# EasyEDA Pro project TEMP_PRO.epro, schematic Schematic_5, sheets 1 to 2 of 3

## Sheets
1 P1: Board Name: Board_5; Create Date: 2025-04-01; Page Name: P1; Project Name: TEMP_PRO-1; Schematic Name: Schematic_5; Update Date: 2025-04-03; Company: EasyEDA.com; Drawed: EasyEDA Pro; Drawn: EasyEDA; Page Size: A3; Part Number: JLCPCB-001; Reviewed: EasyEDA Pro; Version: V0.1
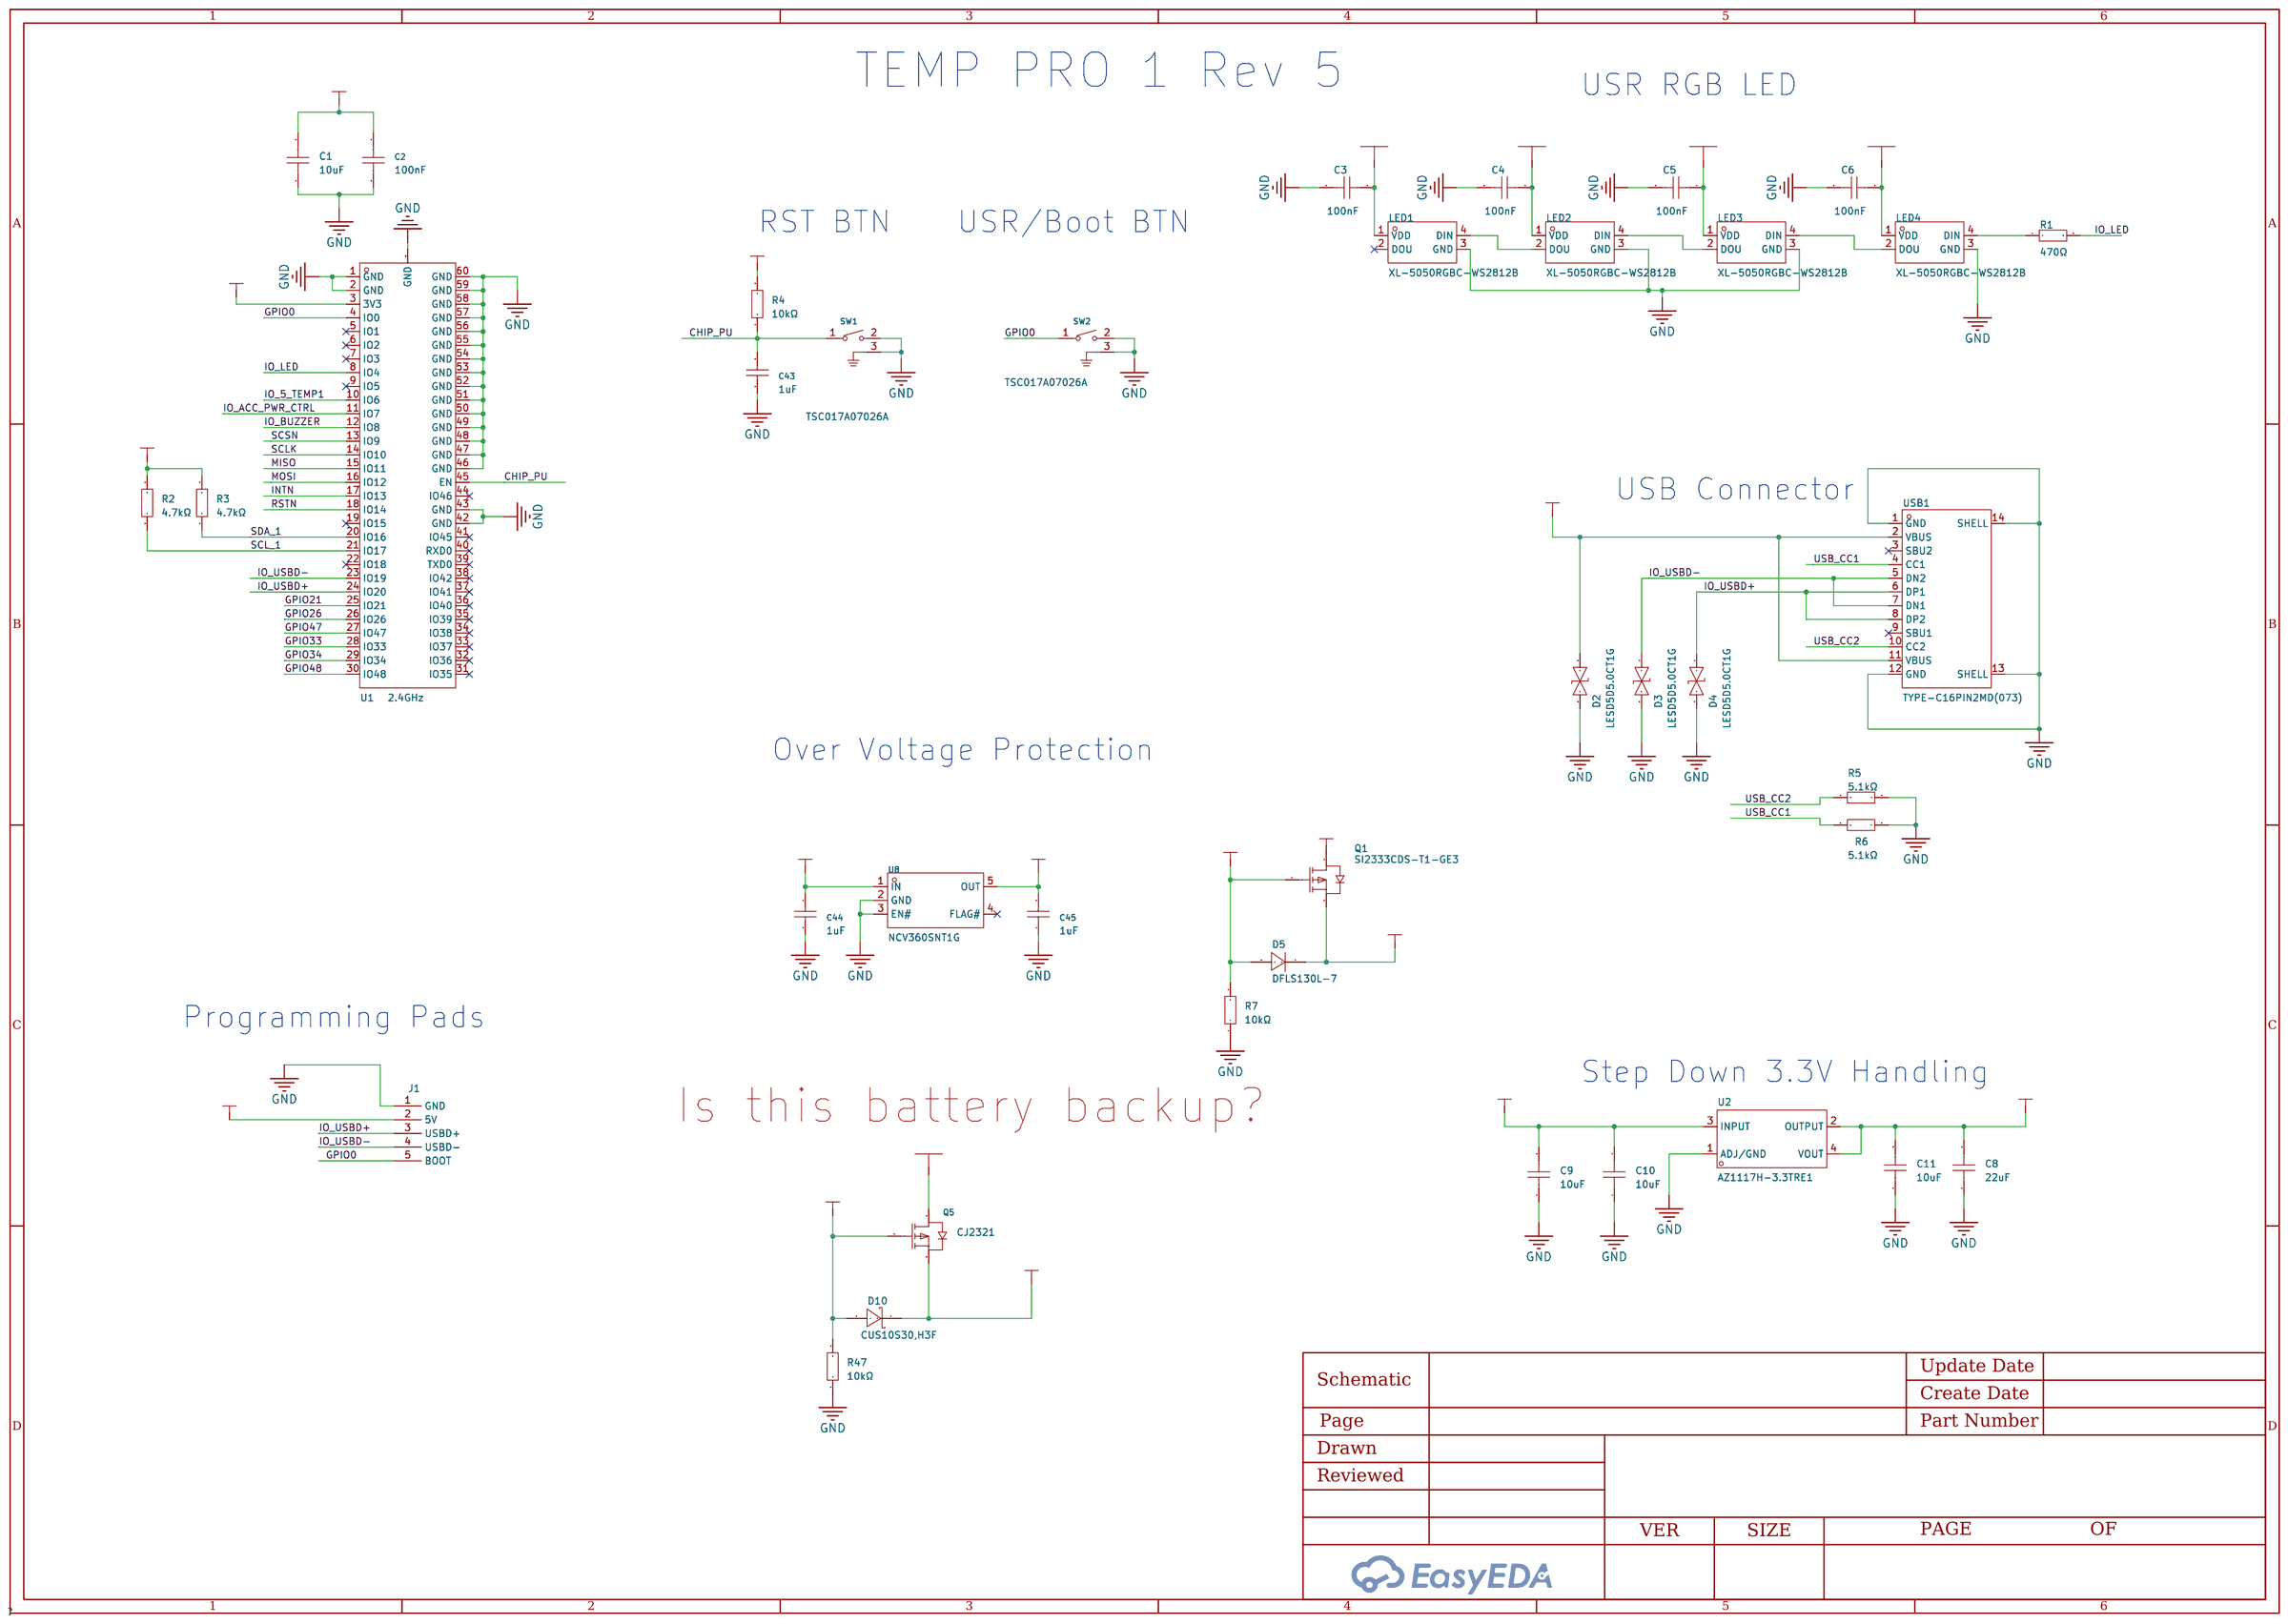
[diagram p0: P1]
2 P2: Board Name: Board_1; Create Date: 2024-09-09
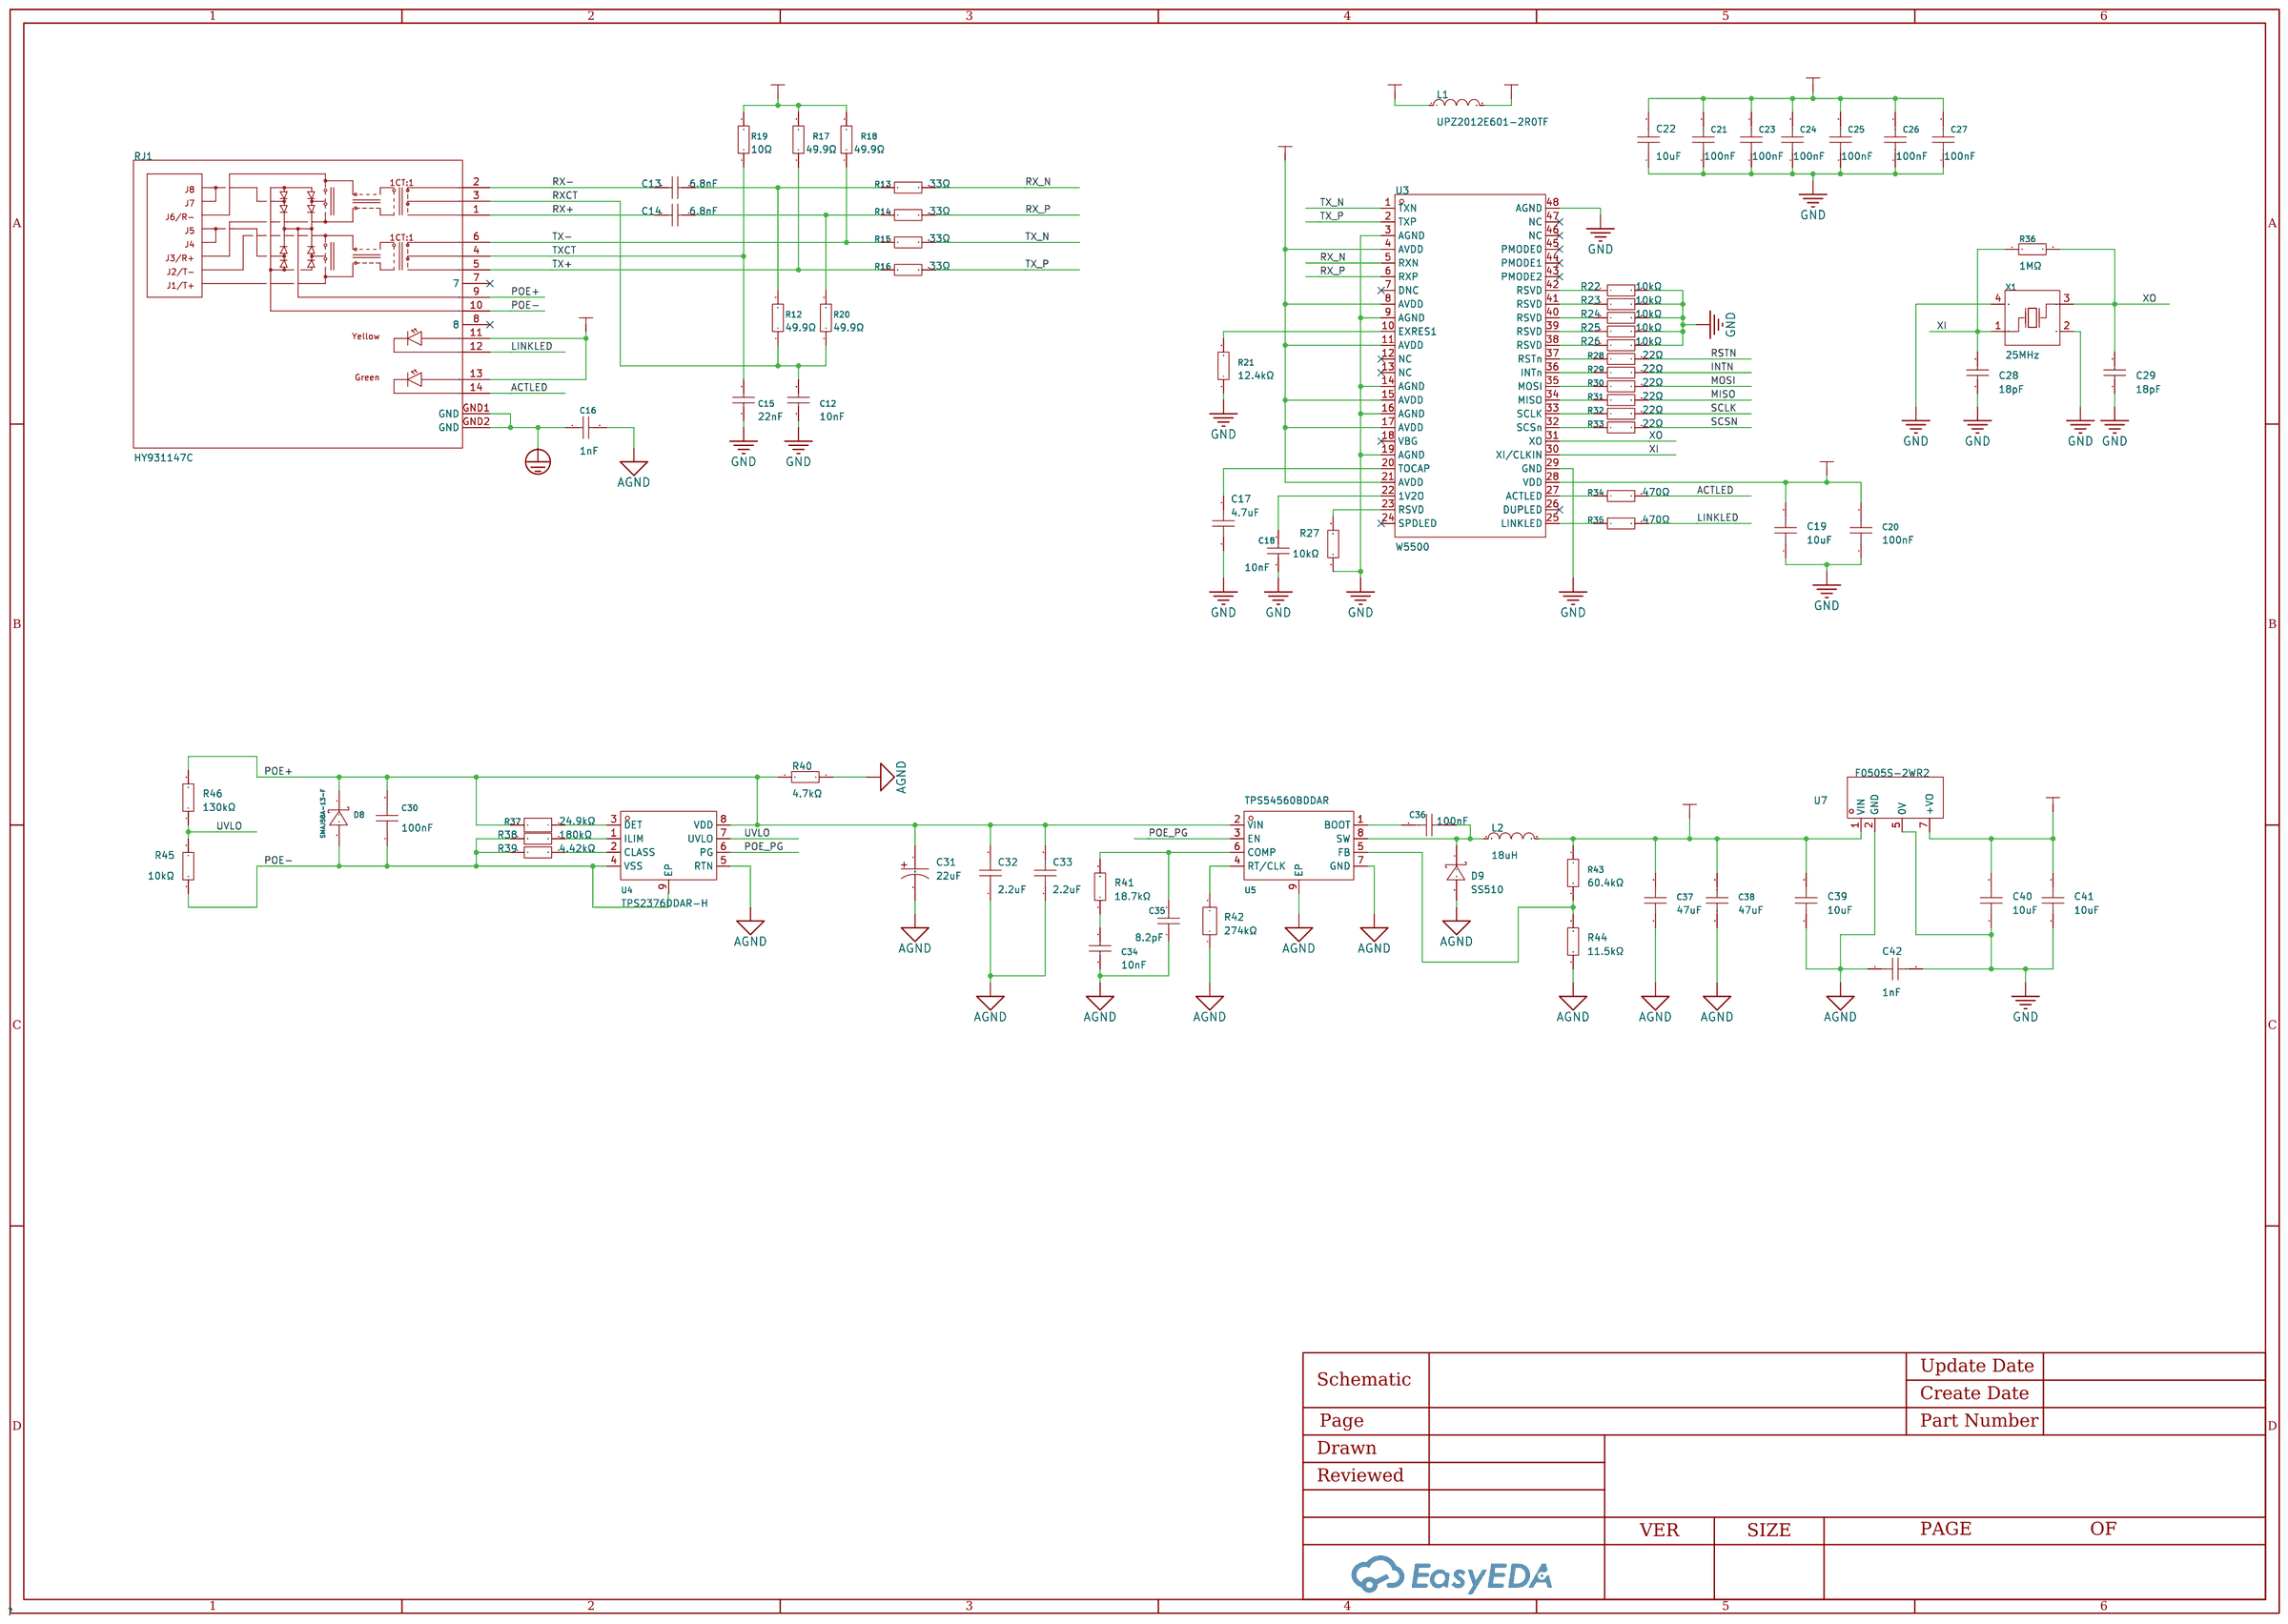
[diagram p1: P2]

## Parts
sheet P1
C1  10uF  [C0603]
C2  100nF  [C0402]
C3  100nF  [C0402]
C4  100nF  [C0402]
C5  100nF  [C0402]
C6  100nF  [C0402]
C8  22uF  [C0805]
C9  10uF  [C0603]
C10  10uF  [C0603]
C11  10uF  [C0603]
C43  1uF  [C0402]
C44  1uF  [C0402]
C45  1uF  [C0402]
D2  LESD5D5.0CT1G  [SOD-523_L1.2-W0.8-LS1.6-BI]
D3  LESD5D5.0CT1G  [SOD-523_L1.2-W0.8-LS1.6-BI]
D4  LESD5D5.0CT1G  [SOD-523_L1.2-W0.8-LS1.6-BI]
D5  DFLS130L-7  [POWERDI-123_L2.8-W1.8-LS3.7-RD]
D10  CUS10S30,H3F  [SOD-323_L1.8-W1.3-LS2.5-RD]
J1  -  [Programming Pads]
LED1  XL-5050RGBC-WS2812B  [LED-SMD_4P-L5.0-W5.0-BL_XL-5050RGBC]
LED2  XL-5050RGBC-WS2812B  [LED-SMD_4P-L5.0-W5.0-BL_XL-5050RGBC]
LED3  XL-5050RGBC-WS2812B  [LED-SMD_4P-L5.0-W5.0-BL_XL-5050RGBC]
LED4  XL-5050RGBC-WS2812B  [LED-SMD_4P-L5.0-W5.0-BL_XL-5050RGBC]
Q1  SI2333CDS-T1-GE3  [SOT-23_L2.9-W1.3-P1.90-LS2.4-BR]
Q5  CJ2321  [SOT-23-3_L2.9-W1.3-P1.90-LS2.4-BR]
R1  470Ω  [R0402]
R2  4.7kΩ  [R0402]
R3  4.7kΩ  [R0402]
R4  10kΩ  [R0402]
R5  5.1kΩ  [R0402]
R6  5.1kΩ  [R0402]
R7  10kΩ  [R0402]
R47  10kΩ  [R0402]
SW1  TSC017A07026A  [SW-TH_3P-L4.5-W7.0-P3.00-LS1.9]
SW2  TSC017A07026A  [SW-TH_3P-L4.5-W7.0-P3.00-LS1.9]
U1  2.4GHz  [BULETM-SMD_ESP32-S3-MINI-1-N8]
U2  AZ1117H-3.3TRE1  [SOT-223-3_L6.5-W3.4-P2.30-LS7.0-BR]
U8  NCV360SNT1G  [TSOP-5_L3.0-W1.5-P0.95-LS2.8-BL]
USB1  TYPE-C16PIN2MD(073)  [USB-C-SMD_TYPE-C-6PIN-2MD-073]
sheet P2
C12  10nF  [C0603]
C13  6.8nF  [C0402]
C14  6.8nF  [C0402]
C15  22nF  [C0603]
C16  1nF  [C1206]
C17  4.7uF  [C0603]
C18  10nF  [C0603]
C19  10uF  [C0603]
C20  100nF  [C0402]
C21  100nF  [C0402]
C22  10uF  [C0603]
C23  100nF  [C0402]
C24  100nF  [C0402]
C25  100nF  [C0402]
C26  100nF  [C0402]
C27  100nF  [C0402]
C28  18pF  [C0402]
C29  18pF  [C0402]
C30  100nF  [C0603]
C31  22uF  [CAP-SMD_BD8.0-L8.3-W8.3-RD]
C32  2.2uF  [C1206]
C33  2.2uF  [C1206]
C34  10nF  [C0402]
C35  8.2pF  [C0402]
C36  100nF  [C0402]
C37  47uF  [C1210]
C38  47uF  [C1210]
C39  10uF  [C0603]
C40  10uF  [C0603]
C41  10uF  [C0603]
C42  1nF  [C1808]
D8  SMAJ58A-13-F  [SMA_L4.4-W2.6-LS5.0-RD]
D9  SS510  [SMA_L4.3-W2.6-LS5.2-RD]
L1  UPZ2012E601-2R0TF  [L0805]
L2  18uH  [IND-SMD_L12.0-W12.0_CDRH127NP]
R12  49.9Ω  [R0402]
R13  33Ω  [R0402]
R14  33Ω  [R0402]
R15  33Ω  [R0402]
R16  33Ω  [R0402]
R17  49.9Ω  [R0402]
R18  49.9Ω  [R0402]
R19  10Ω  [R0402]
R20  49.9Ω  [R0402]
R21  12.4kΩ  [R0402]
R22  10kΩ  [R0402]
R23  10kΩ  [R0402]
R24  10kΩ  [R0402]
R25  10kΩ  [R0402]
R26  10kΩ  [R0402]
R27  10kΩ  [R0402]
R28  22Ω  [R0402]
R29  22Ω  [R0402]
R30  22Ω  [R0402]
R31  22Ω  [R0402]
R32  22Ω  [R0402]
R33  22Ω  [R0402]
R34  470Ω  [R0402]
R35  470Ω  [R0402]
R36  1MΩ  [R0402]
R37  24.9kΩ  [R0402]
R38  180kΩ  [R0402]
R39  4.42kΩ  [R0402]
R40  4.7kΩ  [R2512]
R41  18.7kΩ  [R0402]
R42  274kΩ  [R0402]
R43  60.4kΩ  [R0402]
R44  11.5kΩ  [R0402]
R45  10kΩ  [R0402]
R46  130kΩ  [R0402]
RJ1  HY931147C  [RJ45-TH_HY931147C]
U3  W5500  [LQFP-48_L7.0-W7.0-P0.50-LS9.0-BL]
U4  TPS2376DDAR-H  [SO-8_L4.9-W3.9-P1.27-LS6.0-BL-EP]
U5  TPS54560BDDAR  [POWERPAD-SO-8_L4.9-W3.9-P1.27-LS6.0-BL-EP]
U7  F0505S-2WR2  [PWRM-TH_FXXXXS-1WR2]
X1  25MHz  [CRYSTAL-SMD_4P-L3.2-W2.5-BL]

## Library data of the parts
C1 C19 C22 C39-C41 = GRM188C81C106MA73D: Capacitance: Tolerance:±20% Tolerance:±20% Voltage Rated: Temperature Coefficient:; LCSC Part Name: 10uF ±20% 16V; Supplier Part: C182375; Manufacturer: muRata(村田); Supplier Footprint: 0603; Datasheet: https://atta.szlcsc.com/upload/public/pdf/source/20230811/1729A96BC8A22EEF5EFB369A2EE6989A.pdf; Supplier: LCSC; Tolerance: ±20%
C2-C6 C20 C21 C23-C27 C36 = CC0402KRX7R7BB104: Capacitance: Tolerance:±10% Tolerance:±10% Voltage Rated: Temperature Coefficient:; LCSC Part Name: 100nF ±10% 16V; Supplier Part: C60474; Manufacturer: YAGEO(国巨); Supplier Footprint: 0402; JLCPCB Part Class: Extended Part; Datasheet: https://atta.szlcsc.com/upload/public/pdf/source/20211223/9278FD768280B81DDBEF48FA36411A03.pdf; Supplier: LCSC; Tolerance: ±10%
C8 = GRM21BZ71A226ME15L: Capacitance: Tolerance:±20% Tolerance:±20% Voltage Rated: Temperature Coefficient:; LCSC Part Name: 22uF ±20% 10V; Supplier Part: C907991; Manufacturer: muRata(村田); Supplier Footprint: 0805; Datasheet: https://atta.szlcsc.com/upload/public/pdf/source/20201022/C907991_FDD26F97C89A3C2FF3DDCDE25DF37A4B.pdf; Supplier: LCSC; Tolerance: ±20%
C9-C11 = GRM188Z71A106KA73D: Capacitance: Tolerance:±10% Tolerance:±10% Voltage Rated: Temperature Coefficient:; LCSC Part Name: 10uF ±10% 10V; Supplier Part: C2959727; Manufacturer: muRata(村田); Supplier Footprint: 0603; Datasheet: https://atta.szlcsc.com/upload/public/pdf/source/20220328/6A4892B7E841253269A84FFE395E0578.pdf; Supplier: LCSC; Tolerance: ±10%
C43-C45 = GRM155R61E105KA12D: Capacitance: Tolerance:±10% Tolerance:±10% Voltage Rated: Temperature Coefficient:; LCSC Part Name: 1uF ±10% 25V; Supplier Part: C77009; Manufacturer: muRata(村田); Supplier Footprint: 0402; Datasheet: https://atta.szlcsc.com/upload/public/pdf/source/20180326/C77009_C84F63FC30571BAC77C5C818267378FE.pdf; Supplier: LCSC; Tolerance: ±10%
D2-D4 = LESD5D5.0CT1G: Polarity:Bi-Directional Reverse Stand-Off Voltage (Vrwm):5V Breakdown Voltage (VBR):5.6V Peak Pulse Current(Ipp)@8/20us:9.4A Clamping Voltage@Ipp:18.6V; LCSC Part Name: 双向ESD; Supplier Part: C383211; Manufacturer: LRC(乐山无线电); Supplier Footprint: SOD-523; JLCPCB Part Class: ExtendedPart; Datasheet: https://atta.szlcsc.com/upload/public/pdf/source/20190807/C383211_633DF4B4E2C161403226E5235FE33A1C.pdf; Supplier: LCSC; Polarity: Bi-Directional; Reverse Stand-Off Voltage (Vrwm): 5V; Breakdown Voltage (VBR): 5.6V; Peak Pulse Current(Ipp)@8/20us: 9.4A; Clamping Voltage@Ipp: 18.6V
D5 = DFLS130L-7: Forward Voltage (Vf@If):310mV@1A Reverse Voltage (Vr):30V Average Rectified Current (Io):1A; LCSC Part Name: 电压:30V 电流:1A; Supplier Part: C110493; Manufacturer: DIODES(美台); Supplier Footprint: Power-DI-123; JLCPCB Part Class: Extended Part; Datasheet: https://atta.szlcsc.com/upload/public/pdf/source/20170427/1493286393645.pdf; Supplier: LCSC; Forward Voltage (Vf@If): 310mV@1A; Reverse Voltage (Vr): 30V; Average Rectified Current (Io): 1A
D10 = CUS10S30,H3F: Forward Voltage (Vf@If):230mV@100mA Reverse Voltage (Vr):30V Average Rectified Current (Io):1A Reverse Leakage Current (Ir):500uA@30V; LCSC Part Name: 电压:30V 电流:1A; Supplier Part: C146335; Manufacturer: TOSHIBA(东芝); Supplier Footprint: SC-76(SOD-323); JLCPCB Part Class: Extended Part; Datasheet: https://atta.szlcsc.com/upload/public/pdf/source/20171211/C146335_15129763734771175369.pdf; Supplier: LCSC; Forward Voltage (Vf@If): 230mV@100mA; Reverse Voltage (Vr): 30V; Average Rectified Current (Io): 1A; Reverse Leakage Current (Ir): 500uA@30V
J1 = Programming Pad Comp
LED1 = XL-5050RGBC-WS2812B: Emitted Color:RGB Diode Configuration:- Lens Color:Colorless transparence Dominant Wavelength:- Dominant Wavelength:- Peak Wavelength:625nm；470nm；530nm Color Temperature:- Color Temperature:- Forward Current:- Power Dissipation:- Viewing Angle:120° Mounti; LCSC Part Name: RGB三色 正贴 幻彩; Supplier Part: C2843785; Manufacturer: XINGLIGHT(成兴光); Supplier Footprint: SMD5050; JLCPCB Part Class: Extended Part; Datasheet: https://atta.szlcsc.com/upload/public/pdf/source/20230111/86AAD2096485A2E5BCAB883FF8CBE6FD.pdf; Supplier: LCSC; Emitted Color: RGB; Lens Color: Colorless transparence; Peak Wavelength: 625nm；470nm；530nm; Viewing Angle: 120°; Mounting Sytle: Positive post; Operating Temperature: -30℃~+70℃; NO_CONNECT: yes
LED2-LED4 = XL-5050RGBC-WS2812B: Emitted Color:RGB Diode Configuration:- Lens Color:Colorless transparence Dominant Wavelength:- Dominant Wavelength:- Peak Wavelength:625nm；470nm；530nm Color Temperature:- Color Temperature:- Forward Current:- Power Dissipation:- Viewing Angle:120° Mounti; LCSC Part Name: RGB三色 正贴 幻彩; Supplier Part: C2843785; Manufacturer: XINGLIGHT(成兴光); Supplier Footprint: SMD5050; JLCPCB Part Class: Extended Part; Datasheet: https://atta.szlcsc.com/upload/public/pdf/source/20230111/86AAD2096485A2E5BCAB883FF8CBE6FD.pdf; Supplier: LCSC; Emitted Color: RGB; Lens Color: Colorless transparence; Peak Wavelength: 625nm；470nm；530nm; Viewing Angle: 120°; Mounting Sytle: Positive post; Operating Temperature: -30℃~+70℃
Q1 = SI2333CDS-T1-GE3_C48179: Type: Drain Source Voltage (Vdss): Continuous Drain Current (Id): Power Dissipation (Pd):； Drain Source On Resistance (RDS(on)@Vgs,Id):35mΩ@4.5V,5.1A Gate Threshold Voltage (Vgs(th)@Id):1V@250uA Total Gate Charge (Qg@Vgs):25nC@4.5V Input Capacitance (Ciss; LCSC Part Name: P沟道 耐压:12V 电流:5.1A; Supplier Part: C48179; Manufacturer: VISHAY(威世); Supplier Footprint: SOT-23-3; JLCPCB Part Class: Extended Part; Datasheet: https://atta.szlcsc.com/upload/public/pdf/source/20150504/1457707283392.pdf; Supplier: LCSC; Power Dissipation (Pd): ；; Drain Source On Resistance (RDS(on)@Vgs,Id): 35mΩ@4.5V,5.1A; Gate Threshold Voltage (Vgs(th)@Id): 1V@250uA; Total Gate Charge (Qg@Vgs): 25nC@4.5V; Input Capacitance (Ciss@Vds): 1.225nF@6V; Operating Temperature: -55℃~+150℃@(Tj)
Q5 = CJ2321: Type: Drain Source Voltage (Vdss): Continuous Drain Current (Id): Power Dissipation (Pd): Drain Source On Resistance (RDS(on)@Vgs,Id):57mΩ@10V,3.3A Gate Threshold Voltage (Vgs(th)@Id):900mV Total Gate Charge (Qg@Vgs):13nC Input Capacitance (Ciss@Vds):715p; LCSC Part Name: P沟道 耐压:20V 电流:2.9A; Supplier Part: C77898; Manufacturer: CJ(江苏长电/长晶); Supplier Footprint: SOT-23; JLCPCB Part Class: Extended Part; Datasheet: https://atta.szlcsc.com/upload/public/pdf/source/20160709/1468031842857.pdf; Supplier: LCSC; Drain Source On Resistance (RDS(on)@Vgs,Id): 57mΩ@10V,3.3A; Gate Threshold Voltage (Vgs(th)@Id): 900mV; Total Gate Charge (Qg@Vgs): 13nC; Input Capacitance (Ciss@Vds): 715pF; Reverse Transfer Capacitance (Crss@Vds): 120pF
R1 R34 R35 = 0402WGF4700TCE: Resistance: Tolerance:±1% Tolerance:±1% Power(Watts): Overload Voltage (Max): Temperature Coefficient:±100ppm/℃ Temperature Coefficient:±100ppm/℃ Type:Thick Film Resistors Operating Temperature Range:-55℃~+155℃ Operating Temperature Range:-55℃~+155℃; LCSC Part Name: 470Ω ±1% 62.5mW 厚膜电阻; Supplier Part: C25117; Manufacturer: UNI-ROYAL(厚声); Supplier Footprint: 0402; JLCPCB Part Class: Basic Part; Datasheet: https://atta.szlcsc.com/upload/public/pdf/source/20200306/C422600_1E6D84923E4A46A82E41ADD87F860B5C.pdf; Supplier: LCSC; Tolerance: ±1%; Temperature Coefficient: ±100ppm/℃; Type: Thick Film Resistors; Operating Temperature Range: -55℃~+155℃
R2 R3 = 0402WGF4701TCE: Resistance:4700Ω Tolerance:±1% Tolerance:±1% Power(Watts): Overload Voltage (Max): Temperature Coefficient:±100ppm/℃ Temperature Coefficient:±100ppm/℃ Type:Thick Film Resistors Operating Temperature Range:-55℃~+155℃ Operating Temperature Range:-55℃~+155℃; LCSC Part Name: 4.7kΩ ±1% 62.5mW 厚膜电阻; Supplier Part: C25900; Manufacturer: UNI-ROYAL(厚声); Supplier Footprint: 0402; JLCPCB Part Class: Basic Part; Datasheet: https://atta.szlcsc.com/upload/public/pdf/source/20200306/C422600_1E6D84923E4A46A82E41ADD87F860B5C.pdf; Supplier: LCSC; Tolerance: ±1%; Temperature Coefficient: ±100ppm/℃; Type: Thick Film Resistors; Operating Temperature Range: -55℃~+155℃
R4 R7 R47 = 0402WGF1002TCE: Type:Thick Film Resistors Resistance:10kΩ Tolerance:±1% Tolerance:±1% Power(Watts): Overload Voltage (Max): Temperature Coefficient:±100ppm/℃ Temperature Coefficient:±100ppm/℃ Operating Temperature Range:-55℃~+155℃ Operating Temperature Range:-55℃~+155℃; LCSC Part Name: 10kΩ ±1% 62.5mW 厚膜电阻; Supplier Part: C25744; Manufacturer: UNI-ROYAL(厚声); Supplier Footprint: 0402; JLCPCB Part Class: Basic Part; Datasheet: https://atta.szlcsc.com/upload/public/pdf/source/20200306/C422600_1E6D84923E4A46A82E41ADD87F860B5C.pdf; Supplier: LCSC; Type: Thick Film Resistors; Tolerance: ±1%; Temperature Coefficient: ±100ppm/℃; Operating Temperature Range: -55℃~+155℃
R5 R6 = 0402WGF5101TCE: Type:Thick Film Resistors Resistance:5.1kΩ Tolerance:±1% Tolerance:±1% Power(Watts): Overload Voltage (Max): Temperature Coefficient:±100ppm/℃ Temperature Coefficient:±100ppm/℃ Operating Temperature Range:-55℃~+155℃ Operating Temperature Range:-55℃~+155℃; LCSC Part Name: 5.1kΩ ±1% 62.5mW 厚膜电阻; Supplier Part: C25905; Manufacturer: UNI-ROYAL(厚声); Supplier Footprint: 0402; JLCPCB Part Class: Basic Part; Datasheet: https://atta.szlcsc.com/upload/public/pdf/source/20200306/C422600_1E6D84923E4A46A82E41ADD87F860B5C.pdf; Supplier: LCSC; Type: Thick Film Resistors; Tolerance: ±1%; Temperature Coefficient: ±100ppm/℃; Operating Temperature Range: -55℃~+155℃
SW1 SW2 = TSC017A07026A: Actuator Style:Round Button Operating Force:260gf Mounting Style:Lying Switch Length:4.5mm Switch Width:4.5mm Switch Height:7mm Contact Current:50mA Voltage Rating (AC):- Voltage Rating (DC):12V Mechanical Life:-; LCSC Part Name: 4.5*4.5*7mm 卧插 轻触开关; Supplier Part: C2888533; Manufacturer: BZCN(博众电气); Supplier Footprint: 插件; Datasheet: https://atta.szlcsc.com/upload/public/pdf/source/20210826/53484E62D1502C029467A3638274990F.pdf; Supplier: LCSC; Actuator Style: Round Button; Operating Force: 260gf; Mounting Style: Lying; Switch Length: 4.5mm; Switch Width: 4.5mm; Switch Height: 7mm; Contact Current: 50mA; Voltage Rating (DC): 12V
U1 = ESP32-S3-MINI-1-N8: Core Processor:ESP32-S3FN8 Chip Wireless Standard:- Support Interface:I2C；GPIO；SPI；PWM；ADC；UART；USB；I2S Frequency:2.4GHz Antenna Type:- Output Power:20.5dBm Output Power:20.5dBm Operating Voltage:- Operating Voltage:- Receive  Current:- Send  Current:- Se; Supplier Part: C2913206; Manufacturer: ESPRESSIF(乐鑫); Supplier Footprint: SMD; JLCPCB Part Class: Extended Part; Datasheet: https://atta.szlcsc.com/upload/public/pdf/source/20220425/7F117D7A09F85946280540FD9EFDF9F3.pdf; Supplier: LCSC; Core Processor: ESP32-S3FN8 Chip; Support Interface: I2C；GPIO；SPI；PWM；ADC；UART；USB；I2S; Output Power: 20.5dBm
U2 = AZ1117H-3.3TRE1: Output Type: Maximum Input Voltage:15V Output Voltage:3.3V Output Voltage:3.3V MAX Output Current:1A Power Supply Rejection Ratio (PSRR):75dB@(120Hz) Dropout Voltage:1.25V@(1A) standby current:10mA Operating Temperature:-40℃~+125℃@(Tj) Operating Temperatu; LCSC Part Name: 输入15V 输出3.3V 1A; Supplier Part: C92517; Manufacturer: DIODES(美台); Supplier Footprint: SOT-223-3; JLCPCB Part Class: Extended Part; Datasheet: https://atta.szlcsc.com/upload/public/pdf/source/20170327/1490586099939.pdf; Supplier: LCSC; Maximum Input Voltage: 15V; Output Voltage: 3.3V; MAX Output Current: 1A; Power Supply Rejection Ratio (PSRR): 75dB@(120Hz); Dropout Voltage: 1.25V@(1A); standby current: 10mA; Operating Temperature: -40℃~+125℃@(Tj); Output Polarity: Positive electrode; Number of Outputs: 1
U8 = NCV360SNT1G: LCSC Part Name: 过电压保护电路，USB 正向，带内部 PMOS FET 和状态标志; Supplier Part: C603912; Manufacturer: onsemi(安森美); Supplier Footprint: TSOP-5; Datasheet: https://atta.szlcsc.com/upload/public/pdf/source/20210812/B9A19D5F4A43F37B0375EAD9D9DFE6BA.pdf; Supplier: LCSC
USB1 = TYPE-C 16PIN 2MD(073): Connector Type:Type-C Standard:- Gender:Female Number of Contacts:16 Number of Ports:1 Mounting Style:Surface Mount Current Rating - Power (Max):5A Operating Temperature Range:-25℃~+85℃ Operating Temperature Range:-25℃~+85℃; LCSC Part Name: TYPE-C母座16P4脚插件带定位柱不锈钢外壳2次模顶; Supplier Part: C2765186; Manufacturer: SHOUHAN(首韩); Supplier Footprint: SMD; JLCPCB Part Class: ExtendedPart; Supplier: LCSC; Connector Type: Type-C; Gender: Female; Number of Contacts: 16; Number of Ports: 1; Mounting Style: SurfaceMount; Current Rating - Power (Max): 5A; Operating Temperature Range: -25℃~+85℃
C12 C18 = 0603B103K500NT: Capacitance:10nF Tolerance:±10% Tolerance:±10% Voltage Rated: Temperature Coefficient:; LCSC Part Name: 10nF ±10% 50V; Supplier Part: C57112; Manufacturer: FH(风华); Supplier Footprint: 0603; Datasheet: https://atta.szlcsc.com/upload/public/pdf/source/20200305/C486355_26A10D38EF8C2A5C37091D0039909270.pdf; Supplier: LCSC; Tolerance: ±10%
C13 C14 = 0402B682K500NT: Capacitance:6.8nF Tolerance:±10% Tolerance:±10% Voltage Rated: Temperature Coefficient:; LCSC Part Name: 6.8nF ±10% 50V; Supplier Part: C1542; Manufacturer: FH(风华); Supplier Footprint: 0402; Datasheet: https://atta.szlcsc.com/upload/public/pdf/source/20200305/C486355_26A10D38EF8C2A5C37091D0039909270.pdf; Supplier: LCSC; Tolerance: ±10%
C15 = 0603B223K500NT: Capacitance:22nF Tolerance:±10% Tolerance:±10% Voltage Rated: Temperature Coefficient:; LCSC Part Name: 22nF ±10% 50V; Supplier Part: C77571; Manufacturer: FH(风华); Supplier Footprint: 0603; Datasheet: https://atta.szlcsc.com/upload/public/pdf/source/20200305/C486355_26A10D38EF8C2A5C37091D0039909270.pdf; Supplier: LCSC; Tolerance: ±10%
C16 = CC1206KKX7RDBB102: Capacitance: Tolerance:±10% Tolerance:±10% Voltage Rated: Temperature Coefficient:; LCSC Part Name: 1nF ±10% 2kV; Supplier Part: C23631; Manufacturer: YAGEO(国巨); Supplier Footprint: 1206; Datasheet: https://atta.szlcsc.com/upload/public/pdf/source/20180910/C282080_BCE296114B59C3710FB69343383A5C6E.pdf; Supplier: LCSC; Tolerance: ±10%
C17 = GRM188Z71C475KE21D: Capacitance: Tolerance:±10% Tolerance:±10% Voltage Rated: Temperature Coefficient:; LCSC Part Name: 4.7uF ±10% 16V; Supplier Part: C389010; Manufacturer: muRata(村田); Supplier Footprint: 0603; Datasheet: https://atta.szlcsc.com/upload/public/pdf/source/20190418/C389010_378994D96815F6C3A9D8A85630794D48.pdf; Supplier: LCSC; Tolerance: ±10%
C28 C29 = 0402CG180J500NT: Capacitance: Tolerance:±5% Tolerance:±5% Voltage Rated: Temperature Coefficient:; LCSC Part Name: 18pF ±5% 50V; Supplier Part: C1549; Manufacturer: FH(风华); Supplier Footprint: 0402; Datasheet: https://atta.szlcsc.com/upload/public/pdf/source/20200305/C486355_26A10D38EF8C2A5C37091D0039909270.pdf; Supplier: LCSC; Tolerance: ±5%
C30 = CC0603KRX7R0BB104: Capacitance: Tolerance:±10% Tolerance:±10% Voltage Rated: Temperature Coefficient:; LCSC Part Name: 100nF ±10% 100V; Supplier Part: C113803; Manufacturer: YAGEO(国巨); Supplier Footprint: 0603; Datasheet: https://atta.szlcsc.com/upload/public/pdf/source/20181015/C113803_C823A7F2167996AC3CF21DCEABCAAB90.pdf; Supplier: LCSC; Tolerance: ±10%
C31 = UUR2A220MNL1GS: Capacitance: Tolerance:±20% Tolerance:±20% Rated Voltage: Ripple Current:100mA@120Hz Equivalent Series Resistance(ESR):- φD: L: Lifetime @ Temp:2000hrs@85℃ Operating Temperature:-40℃~+85℃ Operating Temperature:-40℃~+85℃; LCSC Part Name: 22uF ±20% 100V; Supplier Part: C445218; Manufacturer: Nichicon(尼吉康); Supplier Footprint: SMD,D8xL10mm; Datasheet: https://atta.szlcsc.com/upload/public/pdf/source/20191118/C445248_9EFF731C7752FD0D7BE67C802DD107D3.pdf; Supplier: LCSC; Tolerance: ±20%; Ripple Current: 100mA@120Hz; Lifetime @ Temp: 2000hrs@85℃; Operating Temperature: -40℃~+85℃
C32 C33 = CC1206KKX7R0BB225: Capacitance: Tolerance:±10% Tolerance:±10% Voltage Rated: Temperature Coefficient:; LCSC Part Name: 2.2uF ±10% 100V; Supplier Part: C577211; Manufacturer: YAGEO(国巨); Supplier Footprint: 1206; Datasheet: https://atta.szlcsc.com/upload/public/pdf/source/20211215/54859EBD0B88AE2AE5A42330F12918A3.pdf; Supplier: LCSC; Tolerance: ±10%
C34 = GRM155R71H103KA88D: Capacitance: Tolerance:±10% Tolerance:±10% Voltage Rated: Temperature Coefficient:; LCSC Part Name: 10nF ±10% 50V; Supplier Part: C77019; Manufacturer: muRata(村田); Supplier Footprint: 0402; Datasheet: https://atta.szlcsc.com/upload/public/pdf/source/20180326/C77019_6A3693CE1BCE757D6A8B7C99DAE1B441.pdf; Supplier: LCSC; Tolerance: ±10%
C35 = GRM1555C1H8R2CA01D: Capacitance: Voltage Rated: Temperature Coefficient:; LCSC Part Name: 8.2pF 50V; Supplier Part: C76984; Manufacturer: muRata(村田); Supplier Footprint: 0402; Datasheet: https://atta.szlcsc.com/upload/public/pdf/source/20180326/C76984_352C1F3E8A40E8661C36D84933ACC5F9.pdf; Supplier: LCSC
C37 C38 = GRM32ER61C476KE15L: Capacitance: Tolerance:±10% Tolerance:±10% Voltage Rated: Temperature Coefficient:; LCSC Part Name: 47uF ±10% 16V; Supplier Part: C77101; Manufacturer: muRata(村田); Supplier Footprint: 1210; Datasheet: https://atta.szlcsc.com/upload/public/pdf/source/20221202/FF58125DCA7AB78AED268D88B743009A.pdf; Supplier: LCSC; Tolerance: ±10%
C42 = GR442QR73D102KW01L: Capacitance: Tolerance:±10% Tolerance:±10% Voltage Rated: Temperature Coefficient:; LCSC Part Name: 1nF ±10% 2kV; Supplier Part: C76916; Manufacturer: muRata(村田); Supplier Footprint: 1808; Datasheet: https://atta.szlcsc.com/upload/public/pdf/source/20180307/C76916_15204090833591407706.pdf; Supplier: LCSC; Tolerance: ±10%
D8 = SMAJ58A-13-F: Reverse Stand-Off Voltage (Vrwm):58V Maximum Clamping Voltage:93.6V Peak Pulse Current (Ipp)@10/1000us:4.3A Peak Pulse Power Dissipation (Ppp)@10/1000us:400W Breakdown Voltage:64.4V Type:TVS; LCSC Part Name: 单向TVS 58V截止; Supplier Part: C110521; Manufacturer: DIODES(美台); Supplier Footprint: SMA(DO-214AC); Datasheet: https://atta.szlcsc.com/upload/public/pdf/source/20180308/C135025_15204897016241413928.pdf; Supplier: LCSC; Reverse Stand-Off Voltage (Vrwm): 58V; Maximum Clamping Voltage: 93.6V; Peak Pulse Current (Ipp)@10/1000us: 4.3A; Peak Pulse Power Dissipation (Ppp)@10/1000us: 400W; Breakdown Voltage: 64.4V; Type: TVS
D9 = SS510_C65010: Diode Configuration:Single Forward Voltage (Vf@If):850mV@5A Reverse Voltage (Vr):100V Rectified Current:5A Reverse Leakage Current (Ir):1mA@100V; LCSC Part Name: 电压:100V 电流:5A; Supplier Part: C65010; Manufacturer: MDD(辰达半导体); Supplier Footprint: SMA(DO-214AC); Datasheet: https://atta.szlcsc.com/upload/public/pdf/source/20230314/529CD85F9B31F69841D3A079BC07E377.pdf; Supplier: LCSC; Diode Configuration: Single; Forward Voltage (Vf@If): 850mV@5A; Reverse Voltage (Vr): 100V; Rectified Current: 5A; Reverse Leakage Current (Ir): 1mA@100V
L1 = UPZ2012E601-2R0TF: Impedance @ Frequency:600Ω@100MHz Tolerance:±25% Tolerance:±25% DC Resistance:90mΩ Current Rating:2A Circuits:1; LCSC Part Name: 单路 0805磁珠 阻抗600Ω@100MHz; Supplier Part: C98308; Manufacturer: Sunlord(顺络); Supplier Footprint: 0805; Datasheet: https://atta.szlcsc.com/upload/public/pdf/source/20231030/6F67BDFA94A48EA93F9ABB358D1D978C.pdf; Supplier: LCSC; Impedance @ Frequency: 600Ω@100MHz; Tolerance: ±25%; DC Resistance: 90mΩ; Current Rating: 2A; Circuits: 1
L2 = CDRH127NP-180MC: Inductance: Tolerance:±20% Tolerance:±20% Rated Current: Saturation Current (Isat):5.6A DC Resistance (DCR):; LCSC Part Name: 18uH ±20% 5.6A; Supplier Part: C2454078; Manufacturer: Sumida(胜美达); Supplier Footprint: SMD,12x12mm; Datasheet: https://atta.szlcsc.com/upload/public/pdf/source/20210415/AC16EBEC5B50C64C9ECF68AC583442AE.pdf; Supplier: LCSC; Tolerance: ±20%; Saturation Current (Isat): 5.6A
R12 R17 R18 R20 = 0402WGF499JTCE: Type:Thick Film Resistors Resistance:49.9Ω Tolerance:±1% Tolerance:±1% Power(Watts): Overload Voltage (Max): Temperature Coefficient:±100ppm/℃ Temperature Coefficient:±100ppm/℃ Operating Temperature Range:-55℃~+155℃ Operating Temperature Range:-55℃~+155℃; LCSC Part Name: 49.9Ω ±1% 62.5mW 厚膜电阻; Supplier Part: C25120; Manufacturer: UNI-ROYAL(厚声); Supplier Footprint: 0402; JLCPCB Part Class: Basic Part; Datasheet: https://atta.szlcsc.com/upload/public/pdf/source/20200306/C422600_1E6D84923E4A46A82E41ADD87F860B5C.pdf; Supplier: LCSC; Type: Thick Film Resistors; Tolerance: ±1%; Temperature Coefficient: ±100ppm/℃; Operating Temperature Range: -55℃~+155℃
R13-R16 = 0402WGF330JTCE: Type:Thick Film Resistors Resistance:33Ω Tolerance:±1% Tolerance:±1% Power(Watts): Overload Voltage (Max): Temperature Coefficient:±100ppm/℃ Temperature Coefficient:±100ppm/℃ Operating Temperature Range:-55℃~+155℃ Operating Temperature Range:-55℃~+155℃; LCSC Part Name: 33Ω ±1% 62.5mW 厚膜电阻; Supplier Part: C25105; Manufacturer: UNI-ROYAL(厚声); Supplier Footprint: 0402; Datasheet: https://atta.szlcsc.com/upload/public/pdf/source/20200306/C422600_1E6D84923E4A46A82E41ADD87F860B5C.pdf; Supplier: LCSC; Type: Thick Film Resistors; Tolerance: ±1%; Temperature Coefficient: ±100ppm/℃; Operating Temperature Range: -55℃~+155℃
R19 = 0402WGF100JTCE: Type:Thick Film Resistors Resistance:10Ω Tolerance:±1% Tolerance:±1% Power(Watts): Overload Voltage (Max): Temperature Coefficient:±200ppm/℃ Temperature Coefficient:±200ppm/℃ Operating Temperature Range:-55℃~+155℃ Operating Temperature Range:-55℃~+155℃; LCSC Part Name: 10Ω ±1% 62.5mW 厚膜电阻; Supplier Part: C25077; Manufacturer: UNI-ROYAL(厚声); Supplier Footprint: 0402; Datasheet: https://atta.szlcsc.com/upload/public/pdf/source/20200306/C422600_1E6D84923E4A46A82E41ADD87F860B5C.pdf; Supplier: LCSC; Type: Thick Film Resistors; Tolerance: ±1%; Temperature Coefficient: ±200ppm/℃; Operating Temperature Range: -55℃~+155℃
R21 = 0402WGF1242TCE: Type:Thick Film Resistors Resistance:12.4kΩ Tolerance:±1% Tolerance:±1% Power(Watts): Overload Voltage (Max): Temperature Coefficient:±100ppm/℃ Temperature Coefficient:±100ppm/℃ Operating Temperature Range:-55℃~+155℃ Operating Temperature Range:-55℃~+155℃; LCSC Part Name: 12.4kΩ ±1% 62.5mW 厚膜电阻; Supplier Part: C11692; Manufacturer: UNI-ROYAL(厚声); Supplier Footprint: 0402; Datasheet: https://atta.szlcsc.com/upload/public/pdf/source/20200306/C422600_1E6D84923E4A46A82E41ADD87F860B5C.pdf; Supplier: LCSC; Type: Thick Film Resistors; Tolerance: ±1%; Temperature Coefficient: ±100ppm/℃; Operating Temperature Range: -55℃~+155℃
R22-R27 R45 = 0402WGF1002TCE: Type:Thick Film Resistors Resistance:10kΩ Tolerance:±1% Tolerance:±1% Power(Watts): Overload Voltage (Max): Temperature Coefficient:±100ppm/℃ Temperature Coefficient:±100ppm/℃ Operating Temperature Range:-55℃~+155℃ Operating Temperature Range:-55℃~+155℃; LCSC Part Name: 10kΩ ±1% 62.5mW 厚膜电阻; Supplier Part: C25744; Manufacturer: UNI-ROYAL(厚声); Supplier Footprint: 0402; Datasheet: https://atta.szlcsc.com/upload/public/pdf/source/20200306/C422600_1E6D84923E4A46A82E41ADD87F860B5C.pdf; Supplier: LCSC; Type: Thick Film Resistors; Tolerance: ±1%; Temperature Coefficient: ±100ppm/℃; Operating Temperature Range: -55℃~+155℃
R28-R33 = 0402WGF220JTCE: Type:Thick Film Resistors Resistance:22Ω Tolerance:±1% Tolerance:±1% Power(Watts): Overload Voltage (Max): Temperature Coefficient:±100ppm/℃ Temperature Coefficient:±100ppm/℃ Operating Temperature Range:-55℃~+155℃ Operating Temperature Range:-55℃~+155℃; LCSC Part Name: 22Ω ±1% 62.5mW 厚膜电阻; Supplier Part: C25092; Manufacturer: UNI-ROYAL(厚声); Supplier Footprint: 0402; Datasheet: https://atta.szlcsc.com/upload/public/pdf/source/20200306/C422600_1E6D84923E4A46A82E41ADD87F860B5C.pdf; Supplier: LCSC; Type: Thick Film Resistors; Tolerance: ±1%; Temperature Coefficient: ±100ppm/℃; Operating Temperature Range: -55℃~+155℃
R36 = 0402WGF1004TCE: Type:Thick Film Resistors Resistance:1MΩ Tolerance:±1% Tolerance:±1% Power(Watts): Overload Voltage (Max): Temperature Coefficient:±100ppm/℃ Temperature Coefficient:±100ppm/℃ Operating Temperature Range:-55℃~+155℃ Operating Temperature Range:-55℃~+155℃; LCSC Part Name: 1MΩ ±1% 62.5mW 厚膜电阻; Supplier Part: C26083; Manufacturer: UNI-ROYAL(厚声); Supplier Footprint: 0402; Datasheet: https://atta.szlcsc.com/upload/public/pdf/source/20200306/C422600_1E6D84923E4A46A82E41ADD87F860B5C.pdf; Supplier: LCSC; Type: Thick Film Resistors; Tolerance: ±1%; Temperature Coefficient: ±100ppm/℃; Operating Temperature Range: -55℃~+155℃
R37 = ERJ2RKF2492X: Type:Thick Film Resistors Resistance:24.9kΩ Tolerance:±1% Tolerance:±1% Power(Watts): Overload Voltage (Max):- Temperature Coefficient:±100ppm/℃ Temperature Coefficient:±100ppm/℃ Operating Temperature Range:-55℃~+155℃ Operating Temperature Range:-55℃~+155; LCSC Part Name: 24.9kΩ ±1% 100mW 厚膜电阻; Supplier Part: C409904; Manufacturer: PANASONIC(松下); Supplier Footprint: 0402; Datasheet: https://atta.szlcsc.com/upload/public/pdf/source/20190806/C409904_88C5E53F20CD19C8E4FD2CDAC0C831B2.pdf; Supplier: LCSC; Type: Thick Film Resistors; Tolerance: ±1%; Temperature Coefficient: ±100ppm/℃; Operating Temperature Range: -55℃~+155℃
R38 = RC0402FR-07180KL: Type:Thick Film Resistors Resistance: Tolerance:±1% Tolerance:±1% Power(Watts): Overload Voltage (Max): Temperature Coefficient:±100ppm/℃ Temperature Coefficient:±100ppm/℃ Operating Temperature Range:-55℃~+155℃ Operating Temperature Range:-55℃~+155℃; LCSC Part Name: 厚膜电阻 180kΩ ±1% 62.5mW; Supplier Part: C138046; Manufacturer: YAGEO(国巨); Supplier Footprint: 0402; Datasheet: https://atta.szlcsc.com/upload/public/pdf/source/20181009/C309620_DA5935B6E1D48212CB7A533FE518B3C2.pdf; Supplier: LCSC; Type: Thick Film Resistors; Tolerance: ±1%; Temperature Coefficient: ±100ppm/℃; Operating Temperature Range: -55℃~+155℃
R39 = RC0402FR-074K42L: Type:Thick Film Resistors Resistance: Tolerance:±1% Tolerance:±1% Power(Watts): Overload Voltage (Max): Temperature Coefficient:±100ppm/℃ Temperature Coefficient:±100ppm/℃ Operating Temperature Range:-55℃~+155℃ Operating Temperature Range:-55℃~+155℃; LCSC Part Name: 厚膜电阻 4.42kΩ ±1% 62.5mW; Supplier Part: C137967; Manufacturer: YAGEO(国巨); Supplier Footprint: 0402; Datasheet: https://atta.szlcsc.com/upload/public/pdf/source/20181009/C309620_DA5935B6E1D48212CB7A533FE518B3C2.pdf; Supplier: LCSC; Type: Thick Film Resistors; Tolerance: ±1%; Temperature Coefficient: ±100ppm/℃; Operating Temperature Range: -55℃~+155℃
R40 = RC2512JK-074K7L: Type:Thick Film Resistors Resistance: Tolerance:±5% Tolerance:±5% Power(Watts): Overload Voltage (Max):- Temperature Coefficient:±100ppm/℃ Temperature Coefficient:±100ppm/℃ Operating Temperature Range:-55℃~+155℃ Operating Temperature Range:-55℃~+155℃; LCSC Part Name: 厚膜电阻 4.7kΩ ±5% 1W; Supplier Part: C878291; Manufacturer: YAGEO(国巨); Supplier Footprint: 2512; Datasheet: https://atta.szlcsc.com/upload/public/pdf/source/20200729/C77617_95A5CB0DA5B36E247059EF653C0CC0E3.pdf; Supplier: LCSC; Type: Thick Film Resistors; Tolerance: ±5%; Temperature Coefficient: ±100ppm/℃; Operating Temperature Range: -55℃~+155℃
R41 = RC0402FR-0718K7L: Type:Thick Film Resistors Resistance: Tolerance:±1% Tolerance:±1% Power(Watts): Overload Voltage (Max): Temperature Coefficient:±100ppm/℃ Temperature Coefficient:±100ppm/℃ Operating Temperature Range:-55℃~+155℃ Operating Temperature Range:-55℃~+155℃; LCSC Part Name: 厚膜电阻 18.7kΩ ±1% 62.5mW; Supplier Part: C295877; Manufacturer: YAGEO(国巨); Supplier Footprint: 0402; Datasheet: https://atta.szlcsc.com/upload/public/pdf/source/20190612/C295877_EB48C18E5ED517DCFEA9B4531953E1BC.pdf; Supplier: LCSC; Type: Thick Film Resistors; Tolerance: ±1%; Temperature Coefficient: ±100ppm/℃; Operating Temperature Range: -55℃~+155℃
R42 = CRCW0402274KFKED: Type:Thick Film Resistors Resistance: Tolerance:±1% Tolerance:±1% Power(Watts): Overload Voltage (Max): Temperature Coefficient:±100ppm/℃ Temperature Coefficient:±100ppm/℃ Operating Temperature Range:-55℃~+155℃ Operating Temperature Range:-55℃~+155℃; LCSC Part Name: 厚膜电阻 274kΩ ±1% 62.5mW; Supplier Part: C2076814; Manufacturer: VISHAY(威世); Supplier Footprint: 0402; Datasheet: https://atta.szlcsc.com/upload/public/pdf/source/20210503/4CAD3FA9B4C9A749933C1C52DBF827C2.pdf; Supplier: LCSC; Type: Thick Film Resistors; Tolerance: ±1%; Temperature Coefficient: ±100ppm/℃; Operating Temperature Range: -55℃~+155℃
R43 = 0402WGF6042TCE: Type:Thick Film Resistors Resistance:60.4kΩ Tolerance:±1% Tolerance:±1% Power(Watts): Overload Voltage (Max): Temperature Coefficient:±100ppm/℃ Temperature Coefficient:±100ppm/℃ Operating Temperature Range:-55℃~+155℃ Operating Temperature Range:-55℃~+155℃; LCSC Part Name: 60.4kΩ ±1% 62.5mW 厚膜电阻; Supplier Part: C25911; Manufacturer: UNI-ROYAL(厚声); Supplier Footprint: 0402; Datasheet: https://atta.szlcsc.com/upload/public/pdf/source/20200306/C422600_1E6D84923E4A46A82E41ADD87F860B5C.pdf; Supplier: LCSC; Type: Thick Film Resistors; Tolerance: ±1%; Temperature Coefficient: ±100ppm/℃; Operating Temperature Range: -55℃~+155℃
R44 = 0402WGF1152TCE: Type:Thick Film Resistors Resistance:11.5kΩ Tolerance:±1% Tolerance:±1% Power(Watts): Overload Voltage (Max): Temperature Coefficient:±100ppm/℃ Temperature Coefficient:±100ppm/℃ Operating Temperature Range:-55℃~+155℃ Operating Temperature Range:-55℃~+155℃; LCSC Part Name: 11.5kΩ ±1% 62.5mW 厚膜电阻; Supplier Part: C270653; Manufacturer: UNI-ROYAL(厚声); Supplier Footprint: 0402; Datasheet: https://atta.szlcsc.com/upload/public/pdf/source/20200306/C422600_1E6D84923E4A46A82E41ADD87F860B5C.pdf; Supplier: LCSC; Type: Thick Film Resistors; Tolerance: ±1%; Temperature Coefficient: ±100ppm/℃; Operating Temperature Range: -55℃~+155℃
R46 = RC0402FR-07130KL: Type:Thick Film Resistors Resistance: Tolerance:±1% Tolerance:±1% Power(Watts): Overload Voltage (Max): Temperature Coefficient:±100ppm/℃ Temperature Coefficient:±100ppm/℃ Operating Temperature Range:-55℃~+155℃ Operating Temperature Range:-55℃~+155℃; LCSC Part Name: 厚膜电阻 130kΩ ±1% 62.5mW; Supplier Part: C93946; Manufacturer: YAGEO(国巨); Supplier Footprint: 0402; Datasheet: https://atta.szlcsc.com/upload/public/pdf/source/20180821/C275644_0D56F95EFF785E7D9A1FEF436B37DA78.pdf; Supplier: LCSC; Type: Thick Film Resistors; Tolerance: ±1%; Temperature Coefficient: ±100ppm/℃; Operating Temperature Range: -55℃~+155℃
RJ1 = HY931147C: Connector Type:RJ45Receptacle Number of Ports:1 Mounting Style:- Shielding:- LED:WithLED Ratings:- Contact Material:- Contact Plating:- Operating Temperature Range:- Operating Temperature Range:- Soldering Temperature(Max):- PoE:带PoE Supplementary Feature; LCSC Part Name: 带LED; Supplier Part: C91754; Manufacturer: HANRUN(汉仁); Supplier Footprint: 插件; JLCPCB Part Class: Extended Part; Datasheet: https://atta.szlcsc.com/upload/public/pdf/source/20170214/1487040199459.pdf; Supplier: LCSC; Connector Type: RJ45Receptacle; Number of Ports: 1; LED: WithLED; PoE: 带PoE
U3 = W5500: LCSC Part Name: 硬连线TCP/IP嵌入式以太网控制器; Supplier Part: C32843; Manufacturer: WIZNET; Supplier Footprint: LQFP-48(7x7); JLCPCB Part Class: Extended Part; Datasheet: https://atta.szlcsc.com/upload/public/pdf/source/20230714/E10C32B058E0BA54FCE1C1556BE10C07.pdf; Supplier: LCSC
U4 = TPS2376DDAR-H: Type:受电设备(PD) Supply Voltage:0V~57V Supply Voltage:0V~57V Maximum Power:12.95W number of channels:1 Operating Temperature:-40℃~+85℃ Operating Temperature:-40℃~+85℃; Supplier: LCSC; Supplier Part: C544899; Manufacturer: TI(德州仪器); LCSC Part Name: 符合IEEE802.3af 标准并能提供600mA电流的PD控制器; Supplier Footprint: SO-8; Datasheet: https://www.ti.com/cn/lit/gpn/tps2376-h; Type: 受电设备(PD); Supply Voltage: 0V~57V; Maximum Power: 12.95W; number of channels: 1; Operating Temperature: -40℃~+85℃
U5 = TPS54560BDDAR: Function:Step-down type Output Type:Adjustable Input Voltage:4.5V~60V Input Voltage:4.5V~60V Output Voltage:800mV~58.8V Output Voltage:800mV~58.8V Output Current (Max):5A Switching Frequency:500kHz Operating Temperature:-40℃~+150℃@(TJ) Operating Temperatu; Supplier: LCSC; Supplier Part: C1850354; Manufacturer: TI(德州仪器); Supplier Footprint: SO-8; Datasheet: https://www.ti.com/cn/lit/gpn/tps54560b; Function: Step-down type; Output Type: Adjustable; Input Voltage: 4.5V~60V; Output Voltage: 800mV~58.8V; Output Current (Max): 5A; Switching Frequency: 500kHz; Operating Temperature: -40℃~+150℃@(TJ); Synchronous Rectification: NO; Number of Outputs: 1; Topology: Step-down; Switch tube (built-in/external): 内置
U7 = F0505S-2WR2: Supplier Part: C909777; Manufacturer: DEXU(德旭电子); Supplier Footprint: 插件; Datasheet: https://atta.szlcsc.com/upload/public/pdf/source/20220506/11F4803FDD0EE0BCAC344A94E448D374.pdf; Supplier: LCSC
X1 = 7M25000003_C337622: Crystal Type:贴片晶振 Frequency: Normal temperature Frequency Tolerance:±10ppm Normal temperature Frequency Tolerance:±10ppm External load capacitor: Frequency Stability(Full temperature range):±10ppm Frequency Stability(Full temperature range):±10ppm Equival; LCSC Part Name: 25MHz ±10ppm 12pF; Supplier Part: C337622; Manufacturer: TXC(晶技); Manufacturer Part: 7M25000003; Supplier Footprint: SMD3225-4P; Datasheet: https://atta.szlcsc.com/upload/public/pdf/source/20190801/C337622_36C45A08175F5CAC3DFB826C2369F615.pdf; Supplier: LCSC; Crystal Type: 贴片晶振; Normal temperature Frequency Tolerance: ±10ppm; Frequency Stability(Full temperature range): ±10ppm; Equivalent Series Resistance (ESR): 40Ω

## Nets
+3V3_CTRL: C3.1 C4.1 C5.1 C6.1 LED1.1(VDD) LED2.1(VDD) LED3.1(VDD) LED4.1(VDD) ; also on sheet 3
+3V3A: C21.2 C22.2 C23.2 C24.2 C25.2 C26.2 C27.2 L1.2 R17.2 R18.2 R19.2 U3.4(AVDD) U3.8(AVDD) U3.11(AVDD) U3.15(AVDD) U3.17(AVDD) U3.21(AVDD)
+5V_DUAL: D5.1 D10.2(A) Q1.2(S) Q5.1(G) R47.2
+5V_OUT: C44.2 D10.1(K) Q5.2(S) U8.1(IN)
+5V_POE: C40.2 C41.2 D5.2 Q1.1(G) R7.2 U7.7(+VO)
+5V_USB: D2.1 Q1.3(D) USB1.2(VBUS) USB1.11(VBUS)
+5VA: C37.2 C38.2 C39.2 L2.2 R43.1 U7.1(VIN)
+VBAT: Q5.3(D) ; also on sheet 3
AGND: C16.2 C31.2 C32.1 C33.1 C34.1 C35.1 C37.1 C38.1 C39.1 C42.1 D9.2(A) R40.2 R42.1 R44.1 U4.5(RTN) U5.7(GND) U5.9(EP) U7.2(GND)
GND: C1.1 C2.1 C3.2 C4.2 C5.2 C6.2 C8.1 C9.1 C10.1 C11.1 C12.1 C15.1 C17.1 C18.1 C19.1 C20.1 C21.1 C22.1 C23.1 C24.1 C25.1 C26.1 C27.1 C28.1 C29.1 C40.1 C41.1 C42.2 C43.1 C44.1 C45.1 D2.2 D3.2 D4.2 J1.1(GND) LED1.3(GND) LED2.3(GND) LED3.3(GND) LED4.3(GND) R5.1 R6.1 R7.1 R21.1 R22.2 R23.2 R24.2 R25.2 R26.2 R27.1 R47.1 SW1.2 SW1.3 SW2.2 SW2.3 U1.1(GND) U1.2(GND) U1.42(GND) U1.43(GND) U1.46(GND) U1.47(GND) U1.48(GND) U1.49(GND) U1.50(GND) U1.51(GND) U1.52(GND) U1.53(GND) U1.54(GND) U1.55(GND) U1.56(GND) U1.57(GND) U1.58(GND) U1.59(GND) U1.60(GND) U1.GND U2.1(ADJ/GND) U3.3(AGND) U3.9(AGND) U3.14(AGND) U3.16(AGND) U3.19(AGND) U3.29(GND) U3.48(AGND) U7.5(0V) U8.2(GND) U8.3(EN#) USB1.1(GND) USB1.12(GND) USB1.13(SHELL) USB1.14(SHELL) X1.2(GND) X1.4(GND) ; also on sheet 3
VCC_3V3: C1.2 C2.2 C8.2 C11.2 C19.2 C20.2 L1.1 R2.1 R3.1 R4.2 RJ1.11 RJ1.13 U1.3(3V3) U2.2(OUTPUT) U2.4(VOUT) U3.28(VDD) ; also on sheet 3
VCC_5V: C9.2 C10.2 C45.2 J1.2(5V) U2.3(INPUT) U8.5(OUT) ; also on sheet 3
ACTLED: R34.2 RJ1.14
CGND: C16.1 RJ1.GND1(GND) RJ1.GND2(GND)
CHIP_PU: C43.2 R4.1 SW1.1 U1.45(EN)
GPIO0: J1.5(BOOT) SW2.1 U1.4(IO0)
GPIO21: U1.25(IO21) ; also on sheet 3
GPIO26: U1.26(IO26) ; also on sheet 3
GPIO33: U1.28(IO33) ; also on sheet 3
GPIO34: U1.29(IO34) ; also on sheet 3
GPIO47: U1.27(IO47) ; also on sheet 3
GPIO48: U1.30(IO48) ; also on sheet 3
INTN: R29.2 U1.17(IO13)
IO_5_TEMP1: U1.10(IO6) ; also on sheet 3
IO_ACC_PWR_CTRL: U1.11(IO7) ; also on sheet 3
IO_BUZZER: U1.12(IO8) ; also on sheet 3
IO_LED: R1.2 U1.8(IO4)
IO_USBD+: D4.1 J1.3(USBD+) U1.24(IO20) USB1.6(DP1) USB1.8(DP2)
IO_USBD-: D3.1 J1.4(USBD-) U1.23(IO19) USB1.5(DN2) USB1.7(DN1)
LINKLED: R35.2 RJ1.12
MISO: R31.2 U1.15(IO11)
MOSI: R30.2 U1.16(IO12)
POE+: C30.2 C31.1 C32.2 C33.2 D8.1(K) R37.2 R40.1 R46.2 RJ1.9 U4.8(VDD) U5.2(VIN)
POE-: C30.1 D8.2(A) R38.1 R39.1 R45.1 RJ1.10 U4.4(VSS) U4.9(EP)
POE_PG: U4.6(PG) U5.3(EN)
RSTN: R28.2 U1.18(IO14)
RX+: C14.2 RJ1.1
RX-: C13.2 RJ1.2
RX_N: R13.2 U3.5(RXN)
RX_P: R14.2 U3.6(RXP)
RXCT: C12.2 R12.1 R20.1 RJ1.3
SCL_1: R2.2 U1.21(IO17) ; also on sheet 3
SCLK: R32.2 U1.14(IO10)
SCSN: R33.2 U1.13(IO9)
SDA_1: R3.2 U1.20(IO16) ; also on sheet 3
TX+: R16.1 R17.1 RJ1.5
TX-: R15.1 R18.1 RJ1.6
TX_N: R15.2 U3.1(TXN)
TX_P: R16.2 U3.2(TXP)
TXCT: C15.2 R19.1 RJ1.4
USB_CC1: R6.2 USB1.4(CC1)
USB_CC2: R5.2 USB1.10(CC2)
UVLO: R45.2 R46.1 U4.7(UVLO)
XI: C28.2 R36.1 U3.30(XI/CLKIN) X1.1(OSC1)
XO: C29.2 R36.2 U3.31(XO) X1.3(OSC2)
$1N1524: LED4.4(DIN) R1.1
$1N1525: LED2.4(DIN) LED3.2(DOU)
$1N1526: LED3.4(DIN) LED4.2(DOU)
$1N1538: LED1.4(DIN) LED2.2(DOU)
$2N1611: C13.1 R12.2 R13.1
$2N1790: C14.1 R14.1 R20.2
$2N2662: R21.2 U3.10(EXRES1)
$2N2992: C17.2 U3.20(TOCAP)
$2N3059: C18.2 U3.22(1V2O)
$2N3068: R22.1 U3.42(RSVD)
$2N3219: R23.1 U3.41(RSVD)
$2N3258: R24.1 U3.40(RSVD)
$2N3297: R25.1 U3.39(RSVD)
$2N3336: R26.1 U3.38(RSVD)
$2N3426: R27.2 U3.23(RSVD)
$2N3529: R34.1 U3.27(ACTLED)
$2N3533: R35.1 U3.25(LINKLED)
$2N3654: R28.1 U3.37(RSTn)
$2N3698: R29.1 U3.36(INTn)
$2N3739: R30.1 U3.35(MOSI)
$2N3780: R31.1 U3.34(MISO)
$2N3821: R32.1 U3.33(SCLK)
$2N3862: R33.1 U3.32(SCSn)
$2N11478: R38.2 U4.1(ILIM)
$2N11487: R37.1 U4.3(DET)
$2N13890: C34.2 R41.1
$2N13898: C35.2 R41.2 U5.6(COMP)
$2N14130: R42.2 U5.4(RT/CLK)
$2N14327: C36.2 U5.1(BOOT)
$2N14331: C36.1 D9.1(K) L2.1 U5.8(SW)
$2N14631: R43.2 R44.2 U5.5(FB)

Not connected (* = marked no-connect by the designer): LED1 2(DOU)*; R39 2; RJ1 7* 8*; U1 5(IO1)* 6(IO2)* 7(IO3)* 9(IO5)* 19(IO15)* 22(IO18)* 31(IO35)* 32(IO36)* 33(IO37)* 34(IO38)* 35(IO39)* 36(IO40)* 37(IO41)* 38(IO42)* 39(TXD0)* 40(RXD0)* 41(IO45)* 44(IO46)*; U3 7(DNC)* 12(NC)* 13(NC)* 18(VBG)* 24(SPDLED)* 26(DUPLED)* 43(PMODE2)* 44(PMODE1)* 45(PMODE0)* 46(NC)* 47(NC)*; U4 2(CLASS); U8 4(FLAG#)*; USB1 3(SBU2)* 9(SBU1)*

## Notes on the sheets
sheet 1
- TEMP PRO 1 Rev 5
- USR RGB LED
- RST BTN
- USR/Boot BTN
- USB Connector
- Over Voltage Protection
- Programming Pads
- Step Down 3.3V Handling
- Is this battery backup?
